# Altium schematic sheet 00_Top.SchDoc
size A3; SheetNumber: 1; SheetTotal: 6
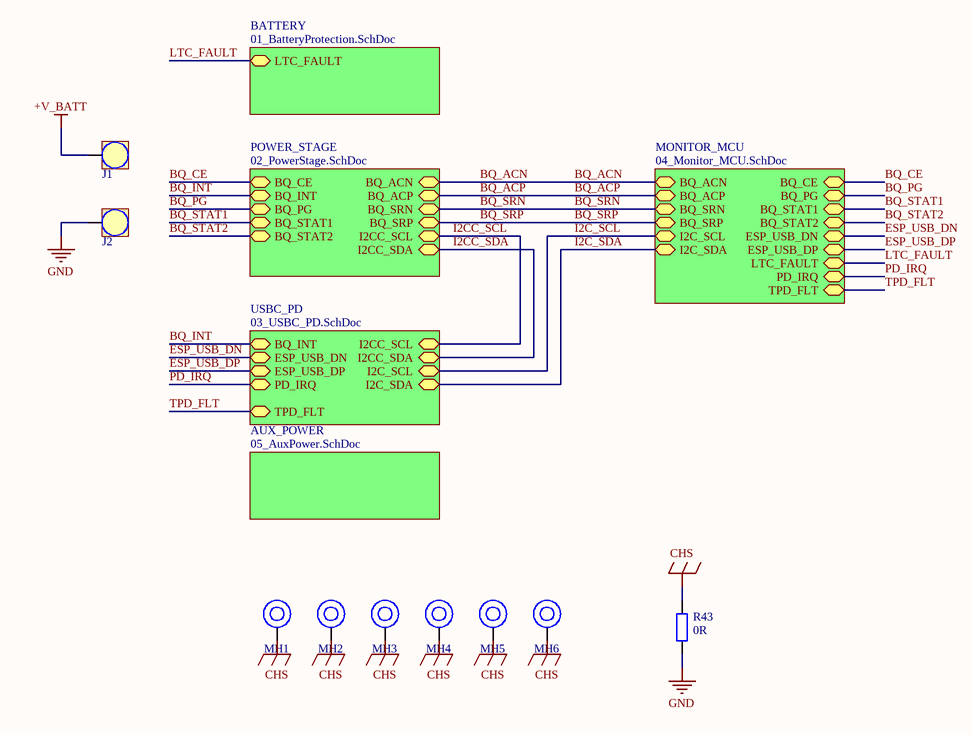
[diagram p0: 00_Top.SchDoc]

## Parts
J1  7460408  [7460408_HAL Surface]  (value not drawn)
J2  7460408  [7460408_HAL Surface]  (value not drawn)
MH1  Mounting-Hole  [MH3.0x7.6]  (value not drawn)  (no BOM)
MH2  Mounting-Hole  [MH3.0x7.6]  (value not drawn)  (no BOM)
MH3  Mounting-Hole  [MH3.0x7.6]  (value not drawn)  (no BOM)
MH4  Mounting-Hole  [MH3.0x7.6]  (value not drawn)  (no BOM)
MH5  Mounting-Hole  [MH3.0x7.6]  (value not drawn)  (no BOM)
MH6  Mounting-Hole  [MH3.0x7.6]  (value not drawn)  (no BOM)
R43  0R  [RESC1608X06N]

## Sub-sheets
AUX_POWER = 05_AuxPower.SchDoc: no entries
BATTERY = 01_BatteryProtection.SchDoc: LTC_FAULT (bidir)
MONITOR_MCU = 04_Monitor_MCU.SchDoc: BQ_ACN (bidir), BQ_ACP (bidir), BQ_SRN (bidir), BQ_SRP (bidir), I2C_SCL (bidir), I2C_SDA (bidir), BQ_CE (bidir), BQ_PG (bidir), BQ_STAT1 (bidir), BQ_STAT2 (bidir), ESP_USB_DN (bidir), ESP_USB_DP (bidir), LTC_FAULT (bidir), PD_IRQ (bidir), TPD_FLT (bidir)
POWER_STAGE = 02_PowerStage.SchDoc: BQ_ACN (bidir), BQ_ACP (bidir), BQ_SRN (bidir), BQ_SRP (bidir), I2CC_SCL (bidir), I2CC_SDA (bidir), BQ_CE (bidir), BQ_INT (bidir), BQ_PG (bidir), BQ_STAT1 (bidir), BQ_STAT2 (bidir)
USBC_PD = 03_USBC_PD.SchDoc: I2CC_SCL (bidir), I2CC_SDA (bidir), I2C_SCL (bidir), I2C_SDA (bidir), BQ_INT (bidir), ESP_USB_DN (bidir), ESP_USB_DP (bidir), PD_IRQ (bidir), TPD_FLT (bidir)

## Nets
+V_BATT: J1.1
CHS: MH1.1 MH2.1 MH3.1 MH4.1 MH5.1 MH6.1 R43.2
GND: J2.1 R43.1
BQ_ACN: sheet POWER_STAGE/BQ_ACN, sheet MONITOR_MCU/BQ_ACN
BQ_ACP: sheet POWER_STAGE/BQ_ACP, sheet MONITOR_MCU/BQ_ACP
BQ_CE: sheet POWER_STAGE/BQ_CE, sheet MONITOR_MCU/BQ_CE
BQ_INT: sheet POWER_STAGE/BQ_INT, sheet USBC_PD/BQ_INT
BQ_PG: sheet POWER_STAGE/BQ_PG, sheet MONITOR_MCU/BQ_PG
BQ_SRN: sheet POWER_STAGE/BQ_SRN, sheet MONITOR_MCU/BQ_SRN
BQ_SRP: sheet POWER_STAGE/BQ_SRP, sheet MONITOR_MCU/BQ_SRP
BQ_STAT1: sheet POWER_STAGE/BQ_STAT1, sheet MONITOR_MCU/BQ_STAT1
BQ_STAT2: sheet POWER_STAGE/BQ_STAT2, sheet MONITOR_MCU/BQ_STAT2
ESP_USB_DN: sheet USBC_PD/ESP_USB_DN, sheet MONITOR_MCU/ESP_USB_DN
ESP_USB_DP: sheet USBC_PD/ESP_USB_DP, sheet MONITOR_MCU/ESP_USB_DP
I2C_SCL: sheet USBC_PD/I2C_SCL, sheet MONITOR_MCU/I2C_SCL
I2C_SDA: sheet USBC_PD/I2C_SDA, sheet MONITOR_MCU/I2C_SDA
I2CC_SCL: sheet POWER_STAGE/I2CC_SCL, sheet USBC_PD/I2CC_SCL
I2CC_SDA: sheet POWER_STAGE/I2CC_SDA, sheet USBC_PD/I2CC_SDA
LTC_FAULT: sheet BATTERY/LTC_FAULT, sheet MONITOR_MCU/LTC_FAULT
PD_IRQ: sheet USBC_PD/PD_IRQ, sheet MONITOR_MCU/PD_IRQ
TPD_FLT: sheet USBC_PD/TPD_FLT, sheet MONITOR_MCU/TPD_FLT

## Library data of the parts
J1 J2 = 7460408: TERM REDCUBE M5 12PIN PCB; Manufacturer 1: Würth Elektronik; Brand: Wurth; Case Style: M5Bush; Brand Number: 7460408; Order Code Supplier: 1821279; Price: 4,17; Supplier: Farnell; Part Name: 7460408; Supplier 1: Digi-Key; Supplier Part Number 1: 732-7460408-ND; Manufacturer Part Number 1: 7460408
MH1-MH6 = Mounting-Hole: MOUNTING HOLE 3.0x7.6MM; Part Name: Mounting-Hole
R43 = ERJ-3GEY0R00V: RES SMD 0 OHM JUMPER 1/10W 0603; Manufacturer 1: Panasonic Electronic Components; AEC-Q200: True; Power (Watts): 0.1W, 1/10W; Resistance: 0 Ohms; Case Code (Imperial): 0603; Manufacturer Part Number 1: ERJ-3GEY0R00V; Part Name: ERJ-3GEY0R00V; Supplier 1: Digi-Key; Supplier Part Number 1: P0.0GCT-ND; Tolerance: Jumper